# Altium schematic sheet BUST_DC_DC.SchDoc
size A2; SheetNumber: 6; SheetTotal: 9
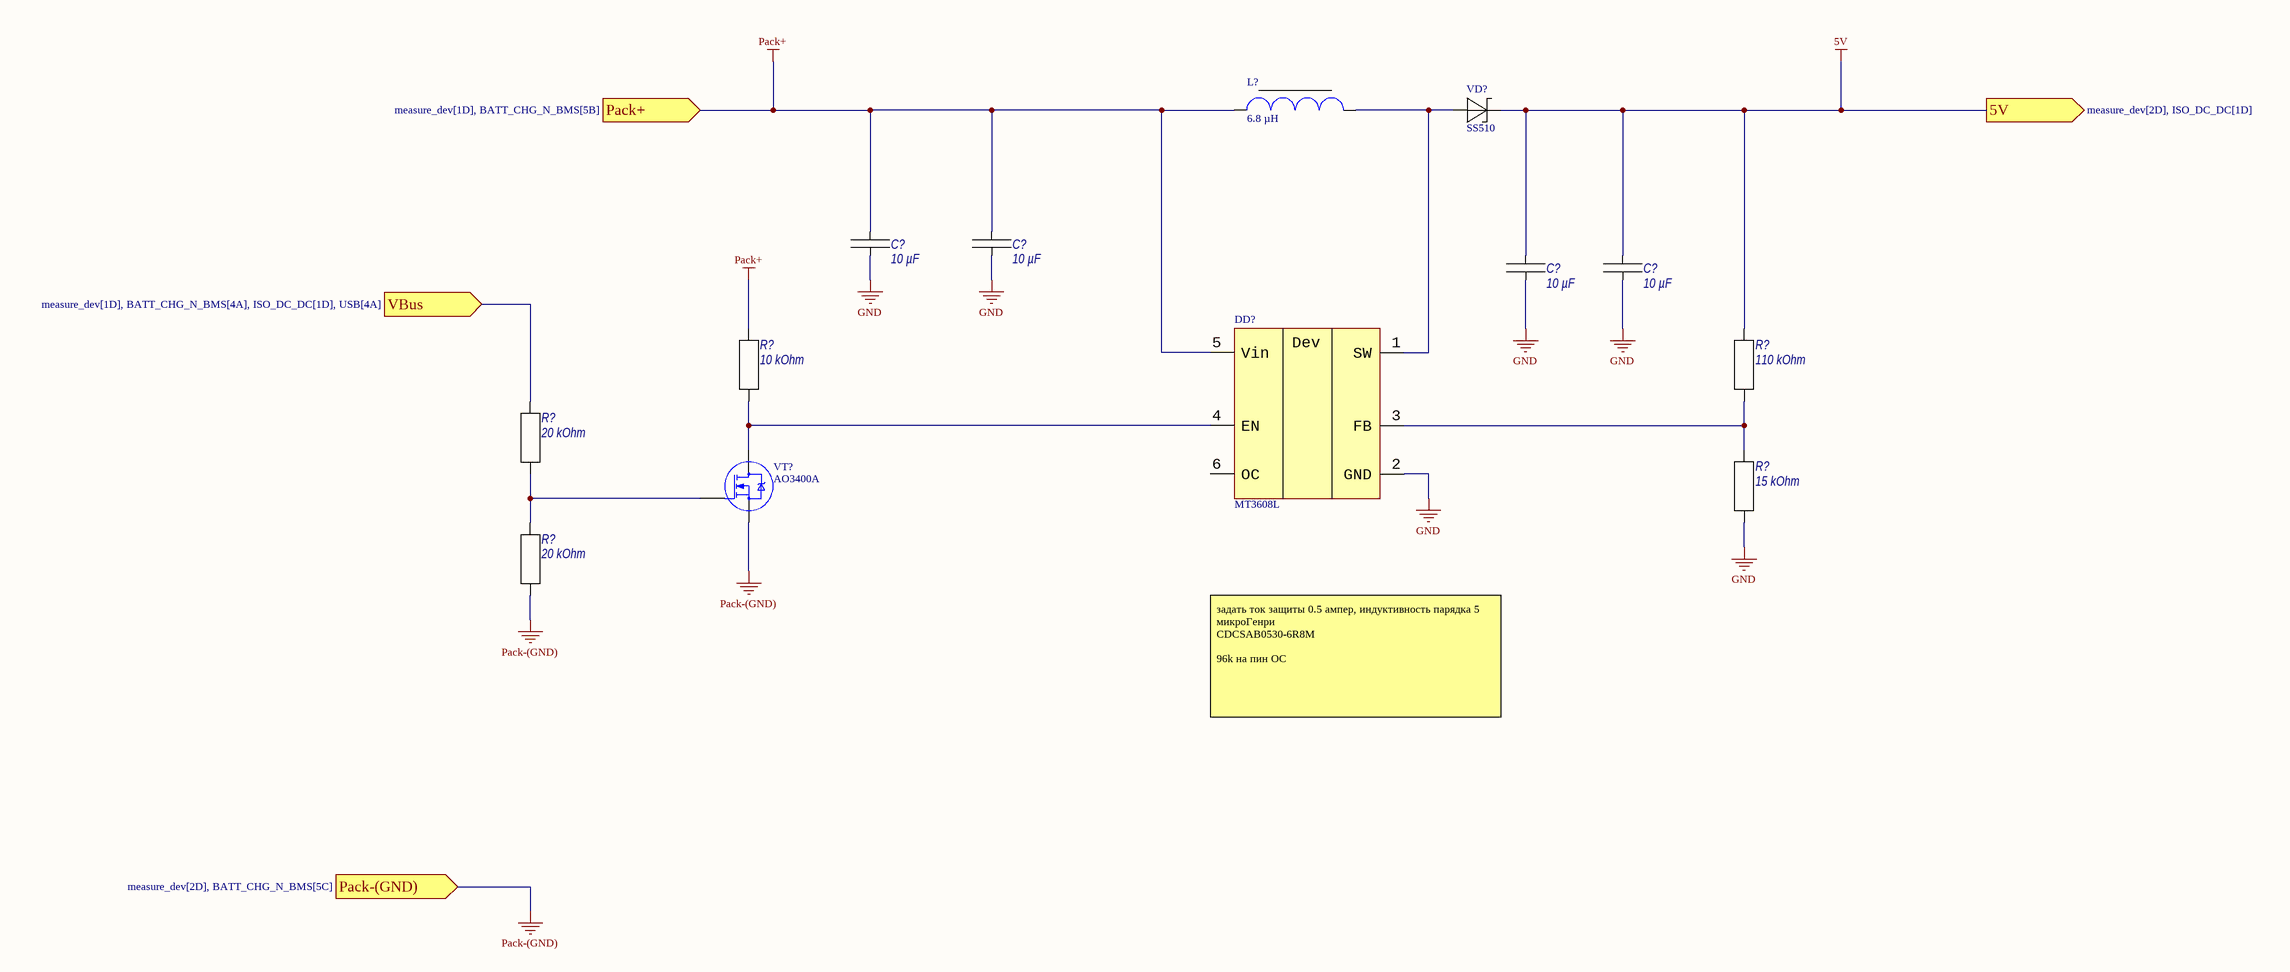
[diagram p0: BUST_DC_DC.SchDoc]

## Parts
(Parts that share a designator on the sheet are numbered #1, #2 ... from top to bottom, then left to right.)
C?#1  10 µF  [1206C]
C?#2  10 µF  [1206C]
C?#3  10 µF  [1206C]
C?#4  10 µF  [1206C]
DD?  MT3608L  [SOT-23-6]
L?  6.8 µH  [INDUCTOR_5.2_5.2_2.8]
R?#1  10 kOhm  [0603R]
R?#2  110 kOhm  [0603R]
R?#3  20 kOhm  [0603R]
R?#4  15 kOhm  [0603R]
R?#5  20 kOhm  [0603R]
VD?  SS510  [DO-214AC]
VT?  AO3400A  [SOT-23-3]

## Ports
5V (out, see measure_dev[2D], ISO_DC_DC[1D]), Pack+ (in, see measure_dev[1D], BATT_CHG_N_BMS[5B]), Pack-(GND) (in, see measure_dev[2D], BATT_CHG_N_BMS[5C]), VBus (in, see measure_dev[1D], BATT_CHG_N_BMS[4A], ISO_DC_DC[1D], USB[4A])

## Nets
5V: C?#3.1 C?#4.1 R?#2.1 VD?.C ; port 5V
GND: C?#1.2 C?#2.2 C?#3.2 C?#4.2 DD?.2(GND) R?#4.2
Pack+: C?#1.1 C?#2.1 DD?.5(Vin) L?.1 R?#1.1 ; port Pack+
Pack-(GND): R?#5.2 VT?.2(S) ; port Pack-(GND)
VBus: R?#3.1 ; port VBus
NetDD?_1: DD?.1(SW) L?.2 VD?.A
NetDD?_3: DD?.3(FB) R?#2.2 R?#4.1
NetDD?_4: DD?.4(EN) R?#1.2 VT?.3(D)
NetR?#3_2: R?#3.2 R?#5.1 VT?.1(G)

Not connected (* = marked no-connect by the designer): DD? 6(OC)

## Notes on the sheet
- задать ток защиты 0.5 ампер, индуктивность парядка 5 микроГенри
  CDCSAB0530-6R8M
  96k на пин OC
- (in symbol MT3608L) Dev

## Library data of the parts
C?#1-C?#4 = CL31B106KBHNNN: Manufacturer: Samsung; Tolerance: 10%; Voltage: 50 V; Dielectric: X7R; Part Number: CL31B106KBHNNN; Package: 1206; Value: 10 µF
DD? = MT3608L: Manufacturer: Aerosemi; max Current: 2.5 A; Vin min: 2.2 V; Vin max: 16 V; Vout max: 20 V; Vref: 0.6 V; Part Number: MT3608L; Package: SOT-23-6; Vout min: -; Type: bust; Datasheet: https://static.chipdip.ru/lib/629/DOC041629802.pdf
L? = CDCSAB0530-6R8M: Manufacturer: SCE; max Current: 4 A; Part Number: CDCSAB0530-6R8M; Package: 5.2*5.2*2.8; Inductance: 6.8 µH; Datasheet: https://static.chipdip.ru/lib/768/DOC047768810.pdf
R?#1 = RC0603FR-0710KL: Manufacturer: Yageo; Tolerance: 1%; Power: 0.100 Watt; Part Number: RC0603FR-0710KL; Package: 0603; Value: 10 kOhm
R?#2 = RC0603FR-07110KL: Manufacturer: Yageo; Tolerance: 1%; Power: 0.100 Watt; Part Number: RC0603FR-07110KL; Package: 0603; Value: 110 kOhm
R?#3 R?#5 = RC0603FR-0720KL: Manufacturer: Yageo; Tolerance: 1%; Power: 0.100 Watt; Part Number: RC0603FR-0720KL; Package: 0603; Value: 20 kOhm
R?#4 = RC0603FR-0715KL: Manufacturer: Yageo; Tolerance: 1%; Power: 0.100 Watt; Part Number: RC0603FR-0715KL; Package: 0603; Value: 15 kOhm
VD? = SS510: Manufacturer: UMW; max Current: 5 A; Reverse Voltage: 100 V; Part Number: SS510; Package: DO-214AC; Pppm: -; Datasheet: https://static.chipdip.ru/lib/293/DOC021293920.pdf
VT? = AO3400A: Manufacturer: UMW; Type: N-chanel; max Ice/max Ids: 5.8 A; Max Ugs: +-12 V; Max Uds: 30 V; Max Rds: 52 mOhm; Part Number: AO3400A; Package: SOT-23-3; Min Ube: -; Max Uce: -; Min h21: -; Datasheet: https://static.chipdip.ru/lib/975/DOC014975392.pdf